# Altium schematic sheet 06_DRAM.SchDoc
size A3; SheetNumber: 9; SheetTotal: 21
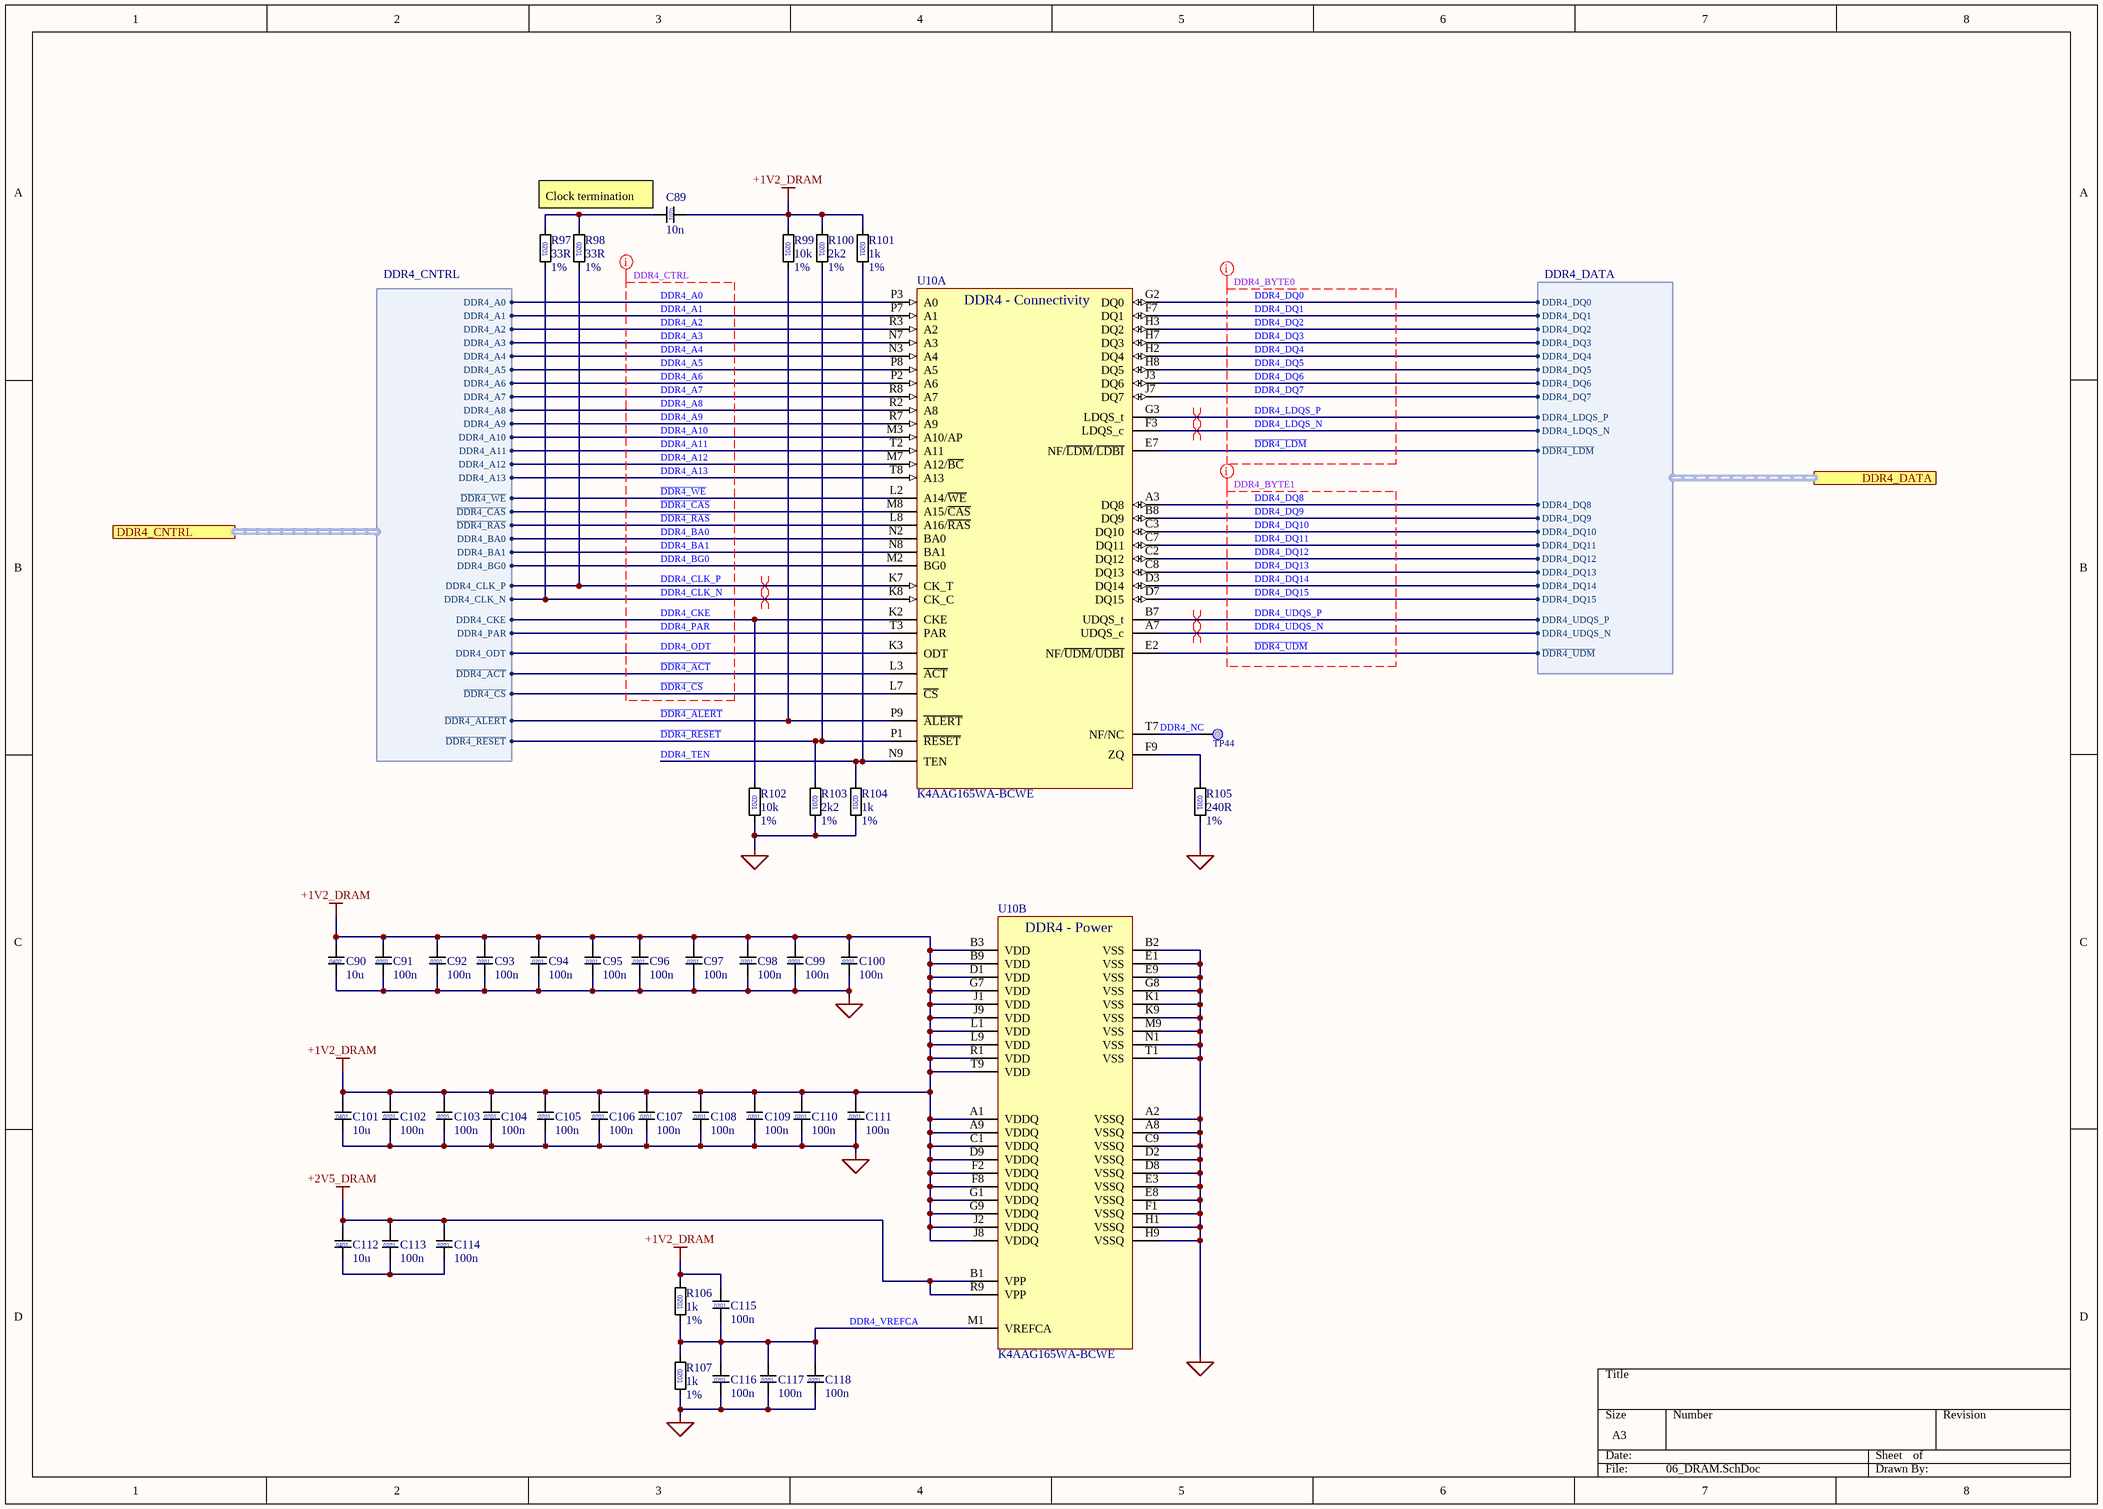
[diagram p0: 06_DRAM.SchDoc]

## Parts
C89  value 10n  [C0201]  (hidden comment: C_0201)
C90  value 10u  [C0402]  (hidden comment: 4u7)
C91  value 100n  [C0201]  (hidden comment: C_0201)
C92  value 100n  [C0201]  (hidden comment: C_0201)
C93  value 100n  [C0201]  (hidden comment: C_0201)
C94  value 100n  [C0201]  (hidden comment: C_0201)
C95  value 100n  [C0201]  (hidden comment: C_0201)
C96  value 100n  [C0201]  (hidden comment: C_0201)
C97  value 100n  [C0201]  (hidden comment: C_0201)
C98  value 100n  [C0201]  (hidden comment: C_0201)
C99  value 100n  [C0201]  (hidden comment: C_0201)
C100  value 100n  [C0201]  (hidden comment: C_0201)
C101  value 10u  [C0402]  (hidden comment: 4u7)
C102  value 100n  [C0201]  (hidden comment: C_0201)
C103  value 100n  [C0201]  (hidden comment: C_0201)
C104  value 100n  [C0201]  (hidden comment: C_0201)
C105  value 100n  [C0201]  (hidden comment: C_0201)
C106  value 100n  [C0201]  (hidden comment: C_0201)
C107  value 100n  [C0201]  (hidden comment: C_0201)
C108  value 100n  [C0201]  (hidden comment: C_0201)
C109  value 100n  [C0201]  (hidden comment: C_0201)
C110  value 100n  [C0201]  (hidden comment: C_0201)
C111  value 100n  [C0201]  (hidden comment: C_0201)
C112  value 10u  [C0402]  (hidden comment: 4u7)
C113  value 100n  [C0201]  (hidden comment: C_0201)
C114  value 100n  [C0201]  (hidden comment: C_0201)
C115  value 100n  [C0201]  (hidden comment: C_0201)
C116  value 100n  [C0201]  (hidden comment: C_0201)
C117  value 100n  [C0201]  (hidden comment: C_0201)
C118  value 100n  [C0201]  (hidden comment: C_0201)
R97  value 33R  Tolerance: 1%  [R0201]  (hidden comment: 0201)
R98  value 33R  Tolerance: 1%  [R0201]  (hidden comment: 0201)
R99  value 10k  Tolerance: 1%  [R0201]  (hidden comment: 0201)
R100  value 2k2  Tolerance: 1%  [R0201]  (hidden comment: 0201)
R101  value 1k  Tolerance: 1%  [R0201]  (hidden comment: 0201)
R102  value 10k  Tolerance: 1%  [R0201]  (hidden comment: 0201)
R103  value 2k2  Tolerance: 1%  [R0201]  (hidden comment: 0201)
R104  value 1k  Tolerance: 1%  [R0201]  (hidden comment: 0201)
R105  value 240R  Tolerance: 1%  [R0201]  (hidden comment: 0201)
R106  value 1k  Tolerance: 1%  [R0201]  (hidden comment: 0201)
R107  value 1k  Tolerance: 1%  [R0201]  (hidden comment: 0201)
TP44  Testpoint 0.5mm  [TP_0.50mm]  (value not drawn)  (no BOM)
U10  K4AAG165WA-BCWE  [FBGA-96_8x14mm_Layout9x16_P0.8mm]  (parts A,B of 2)

## Ports
DDR4_CNTRL (harness DDR4_CNTRL, see 01_SBC_SCH[3A], 02_SoC_DRAM_DDR4[1B]), DDR4_DATA (harness DDR4_DATA, see 01_SBC_SCH[3A], 02_SoC_DRAM_DDR4[7B])

## Harnesses
DDR4_CNTRL: DDR4_A0, DDR4_A1, DDR4_A2, DDR4_A3, DDR4_A4, DDR4_A5, DDR4_A6, DDR4_A7, DDR4_A8, DDR4_A9, DDR4_A10, DDR4_A11, DDR4_A12, DDR4_A13, ~{DDR4_WE}, ~{DDR4_CAS}, ~{DDR4_RAS}, DDR4_BA0, DDR4_BA1, DDR4_BG0, DDR4_CLK_P, DDR4_CLK_N, DDR4_CKE, DDR4_PAR, DDR4_ODT, ~{DDR4_ACT}, ~{DDR4_CS}, ~{DDR4_ALERT}, ~{DDR4_RESET}
DDR4_DATA: DDR4_DQ0, DDR4_DQ1, DDR4_DQ2, DDR4_DQ3, DDR4_DQ4, DDR4_DQ5, DDR4_DQ6, DDR4_DQ7, DDR4_LDQS_P, DDR4_LDQS_N, ~{DDR4_LDM}, DDR4_DQ8, DDR4_DQ9, DDR4_DQ10, DDR4_DQ11, DDR4_DQ12, DDR4_DQ13, DDR4_DQ14, DDR4_DQ15, DDR4_UDQS_P, DDR4_UDQS_N, ~{DDR4_UDM}

## Nets
+1V2_DRAM: C89.2 C90.1 C91.1 C92.1 C93.1 C94.1 C95.1 C96.1 C97.1 C98.1 C99.1 C100.1 C101.1 C102.1 C103.1 C104.1 C105.1 C106.1 C107.1 C108.1 C109.1 C110.1 C111.1 C115.1 R99.1 R100.1 R101.1 R106.1 U10.A1(VDDQ) U10.A9(VDDQ) U10.B3(VDD) U10.B9(VDD) U10.C1(VDDQ) U10.D1(VDD) U10.D9(VDDQ) U10.F2(VDDQ) U10.F8(VDDQ) U10.G1(VDDQ) U10.G7(VDD) U10.G9(VDDQ) U10.J1(VDD) U10.J2(VDDQ) U10.J8(VDDQ) U10.J9(VDD) U10.L1(VDD) U10.L9(VDD) U10.R1(VDD) U10.T9(VDD)
+2V5_DRAM: C112.1 C113.1 C114.1 U10.B1(VPP) U10.R9(VPP)
GND: C90.2 C91.2 C92.2 C93.2 C94.2 C95.2 C96.2 C97.2 C98.2 C99.2 C100.2 C101.2 C102.2 C103.2 C104.2 C105.2 C106.2 C107.2 C108.2 C109.2 C110.2 C111.2 C116.2 C117.2 C118.2 R102.2 R103.2 R104.2 R105.2 R107.2 U10.A2(VSSQ) U10.A8(VSSQ) U10.B2(VSS) U10.C9(VSSQ) U10.D2(VSSQ) U10.D8(VSSQ) U10.E1(VSS) U10.E3(VSSQ) U10.E8(VSSQ) U10.E9(VSS) U10.F1(VSSQ) U10.G8(VSS) U10.H1(VSSQ) U10.H9(VSSQ) U10.K1(VSS) U10.K9(VSS) U10.M9(VSS) U10.N1(VSS) U10.T1(VSS)
~{DDR4_ACT}: U10.L3(~{ACT}) ; port DDR4_CNTRL.~{DDR4_ACT}
~{DDR4_ALERT}: R99.2 U10.P9(~{ALERT}) ; port DDR4_CNTRL.~{DDR4_ALERT}
~{DDR4_CAS}: U10.M8(A15/~{CAS}) ; port DDR4_CNTRL.~{DDR4_CAS}
~{DDR4_CS}: U10.L7(~{CS}) ; port DDR4_CNTRL.~{DDR4_CS}
~{DDR4_LDM}: U10.E7(NF/~{LDM}/~{LDBI}) ; port DDR4_DATA.~{DDR4_LDM}
~{DDR4_RAS}: U10.L8(A16/~{RAS}) ; port DDR4_CNTRL.~{DDR4_RAS}
~{DDR4_RESET}: R100.2 R103.1 U10.P1(~{RESET}) ; port DDR4_CNTRL.~{DDR4_RESET}
~{DDR4_UDM}: U10.E2(NF/~{UDM}/~{UDBI}) ; port DDR4_DATA.~{DDR4_UDM}
~{DDR4_WE}: U10.L2(A14/~{WE}) ; port DDR4_CNTRL.~{DDR4_WE}
DDR4_A0: U10.P3(A0) ; port DDR4_CNTRL.DDR4_A0
DDR4_A1: U10.P7(A1) ; port DDR4_CNTRL.DDR4_A1
DDR4_A2: U10.R3(A2) ; port DDR4_CNTRL.DDR4_A2
DDR4_A3: U10.N7(A3) ; port DDR4_CNTRL.DDR4_A3
DDR4_A4: U10.N3(A4) ; port DDR4_CNTRL.DDR4_A4
DDR4_A5: U10.P8(A5) ; port DDR4_CNTRL.DDR4_A5
DDR4_A6: U10.P2(A6) ; port DDR4_CNTRL.DDR4_A6
DDR4_A7: U10.R8(A7) ; port DDR4_CNTRL.DDR4_A7
DDR4_A8: U10.R2(A8) ; port DDR4_CNTRL.DDR4_A8
DDR4_A9: U10.R7(A9) ; port DDR4_CNTRL.DDR4_A9
DDR4_A10: U10.M3(A10/AP) ; port DDR4_CNTRL.DDR4_A10
DDR4_A11: U10.T2(A11) ; port DDR4_CNTRL.DDR4_A11
DDR4_A12: U10.M7(A12/~{BC}) ; port DDR4_CNTRL.DDR4_A12
DDR4_A13: U10.T8(A13) ; port DDR4_CNTRL.DDR4_A13
DDR4_BA0: U10.N2(BA0) ; port DDR4_CNTRL.DDR4_BA0
DDR4_BA1: U10.N8(BA1) ; port DDR4_CNTRL.DDR4_BA1
DDR4_BG0: U10.M2(BG0) ; port DDR4_CNTRL.DDR4_BG0
DDR4_CKE: R102.1 U10.K2(CKE) ; port DDR4_CNTRL.DDR4_CKE
DDR4_CLK_N: R97.2 U10.K8(CK_C) ; port DDR4_CNTRL.DDR4_CLK_N
DDR4_CLK_P: R98.2 U10.K7(CK_T) ; port DDR4_CNTRL.DDR4_CLK_P
DDR4_DQ0: U10.G2(DQ0) ; port DDR4_DATA.DDR4_DQ0
DDR4_DQ1: U10.F7(DQ1) ; port DDR4_DATA.DDR4_DQ1
DDR4_DQ2: U10.H3(DQ2) ; port DDR4_DATA.DDR4_DQ2
DDR4_DQ3: U10.H7(DQ3) ; port DDR4_DATA.DDR4_DQ3
DDR4_DQ4: U10.H2(DQ4) ; port DDR4_DATA.DDR4_DQ4
DDR4_DQ5: U10.H8(DQ5) ; port DDR4_DATA.DDR4_DQ5
DDR4_DQ6: U10.J3(DQ6) ; port DDR4_DATA.DDR4_DQ6
DDR4_DQ7: U10.J7(DQ7) ; port DDR4_DATA.DDR4_DQ7
DDR4_DQ8: U10.A3(DQ8) ; port DDR4_DATA.DDR4_DQ8
DDR4_DQ9: U10.B8(DQ9) ; port DDR4_DATA.DDR4_DQ9
DDR4_DQ10: U10.C3(DQ10) ; port DDR4_DATA.DDR4_DQ10
DDR4_DQ11: U10.C7(DQ11) ; port DDR4_DATA.DDR4_DQ11
DDR4_DQ12: U10.C2(DQ12) ; port DDR4_DATA.DDR4_DQ12
DDR4_DQ13: U10.C8(DQ13) ; port DDR4_DATA.DDR4_DQ13
DDR4_DQ14: U10.D3(DQ14) ; port DDR4_DATA.DDR4_DQ14
DDR4_DQ15: U10.D7(DQ15) ; port DDR4_DATA.DDR4_DQ15
DDR4_LDQS_N: U10.F3(LDQS_c) ; port DDR4_DATA.DDR4_LDQS_N
DDR4_LDQS_P: U10.G3(LDQS_t) ; port DDR4_DATA.DDR4_LDQS_P
DDR4_NC: TP44.TP U10.T7(NF/NC)
DDR4_ODT: U10.K3(ODT) ; port DDR4_CNTRL.DDR4_ODT
DDR4_PAR: U10.T3(PAR) ; port DDR4_CNTRL.DDR4_PAR
DDR4_TEN: R101.2 R104.1 U10.N9(TEN)
DDR4_UDQS_N: U10.A7(UDQS_c) ; port DDR4_DATA.DDR4_UDQS_N
DDR4_UDQS_P: U10.B7(UDQS_t) ; port DDR4_DATA.DDR4_UDQS_P
DDR4_VREFCA: C115.2 C116.1 C117.1 C118.1 R106.2 R107.1 U10.M1(VREFCA)
NetC89_1: C89.1 R97.1 R98.1
NetC112_2: C112.2 C113.2 C114.2
NetR105_1: R105.1 U10.F9(ZQ)

## Layout directives
net class DDR4_BYTE0; rule Length Constraint [Min Delay = 0ps    Max Delay = 500ps]; rule Matched Net Lengths [Delay Tolerance = 0.4ps]; rule Matched Net Lengths [Delay Tolerance = 2ps]; net class SE45: DDR4_DQ0, DDR4_DQ1, DDR4_DQ2, DDR4_DQ3, DDR4_DQ4, DDR4_DQ5, DDR4_DQ6, DDR4_DQ7, DDR4_LDQS_N, DDR4_LDQS_P, ~{DDR4_LDM}
net class DDR4_BYTE1; rule Length Constraint [Min Delay = 0ps    Max Delay = 500ps]; rule Matched Net Lengths [Delay Tolerance = 0.4ps]; rule Matched Net Lengths [Delay Tolerance = 2ps]; net class SE45: DDR4_DQ8, DDR4_DQ9, DDR4_DQ10, DDR4_DQ11, DDR4_DQ12, DDR4_DQ13, DDR4_DQ14, DDR4_DQ15, DDR4_UDQS_N, DDR4_UDQS_P, ~{DDR4_UDM}
differential pair; differential pair class DIFF85: DDR4_CLK_N, DDR4_CLK_P, DDR4_LDQS_N, DDR4_LDQS_P, DDR4_UDQS_N, DDR4_UDQS_P
net class DDR4_CTRL; rule Matched Net Lengths [Delay Tolerance = 3ps]; rule Length Constraint [Min Delay = 0ps    Max Delay = 500ps]; net class SE45; rule Matched Net Lengths [Delay Tolerance = 0.4ps]: DDR4_A0, DDR4_A1, DDR4_A2, DDR4_A3, DDR4_A4, DDR4_A5, DDR4_A6, DDR4_A7, DDR4_A8, DDR4_A9, DDR4_A10, DDR4_A11, DDR4_A12, DDR4_A13, DDR4_BA0, DDR4_BA1, DDR4_BG0, DDR4_CKE, DDR4_CLK_N, DDR4_CLK_P, DDR4_ODT, DDR4_PAR, ~{DDR4_ACT}, ~{DDR4_CAS}, ~{DDR4_CS}, ~{DDR4_RAS}, ~{DDR4_WE}

## Notes on the sheet
- (near C89) Clock termination
- (in symbol C_0201) 0201
- (in symbol C_0402) 0402
- (in symbol K4AAG165WA-BCWE, part A) DDR4 - Connectivity
- (in symbol K4AAG165WA-BCWE, part B) DDR4 - Power

## Library data of the parts
C89 C91-C100 C102-C111 C113-C118 = C_0201: MLCC 0201; Manufacturer_Name: *; Manufacturer_Part_Number: *
C90 C101 C112 = C_0402: MLCC 0402; Manufacturer_Name: *; Manufacturer_Part_Number: *
R97-R107 = R_0201: Manufacturer_Name: *; Manufacturer_Part_Number: *
U10 = K4AAG165WA-BCWE: 1G x 16-bit (16 Gbit) CMOS Double Data Rate IV Synchronous RAM, FBGA-96; KiCad_Footprint: Package_BGA:Samsung_FBGA-96_8x14mm_Layout9x16_P0.8mm; Datasheet: https://www.alldatasheet.com/datasheet-pdf/pdf/1643784/SAMSUNG/K4AAG165WA-BCWE.html; ComponentLink1Description: Datasheet; ComponentLink1URL: https://www.alldatasheet.com/datasheet-pdf/pdf/1643784/SAMSUNG/K4AAG165WA-BCWE.html; Manufacturer_Name: *; Manufacturer_Part_Number: *